# EAGLE schematic IDP_Main_Node_Carrier (EAGLE 7.7.0)
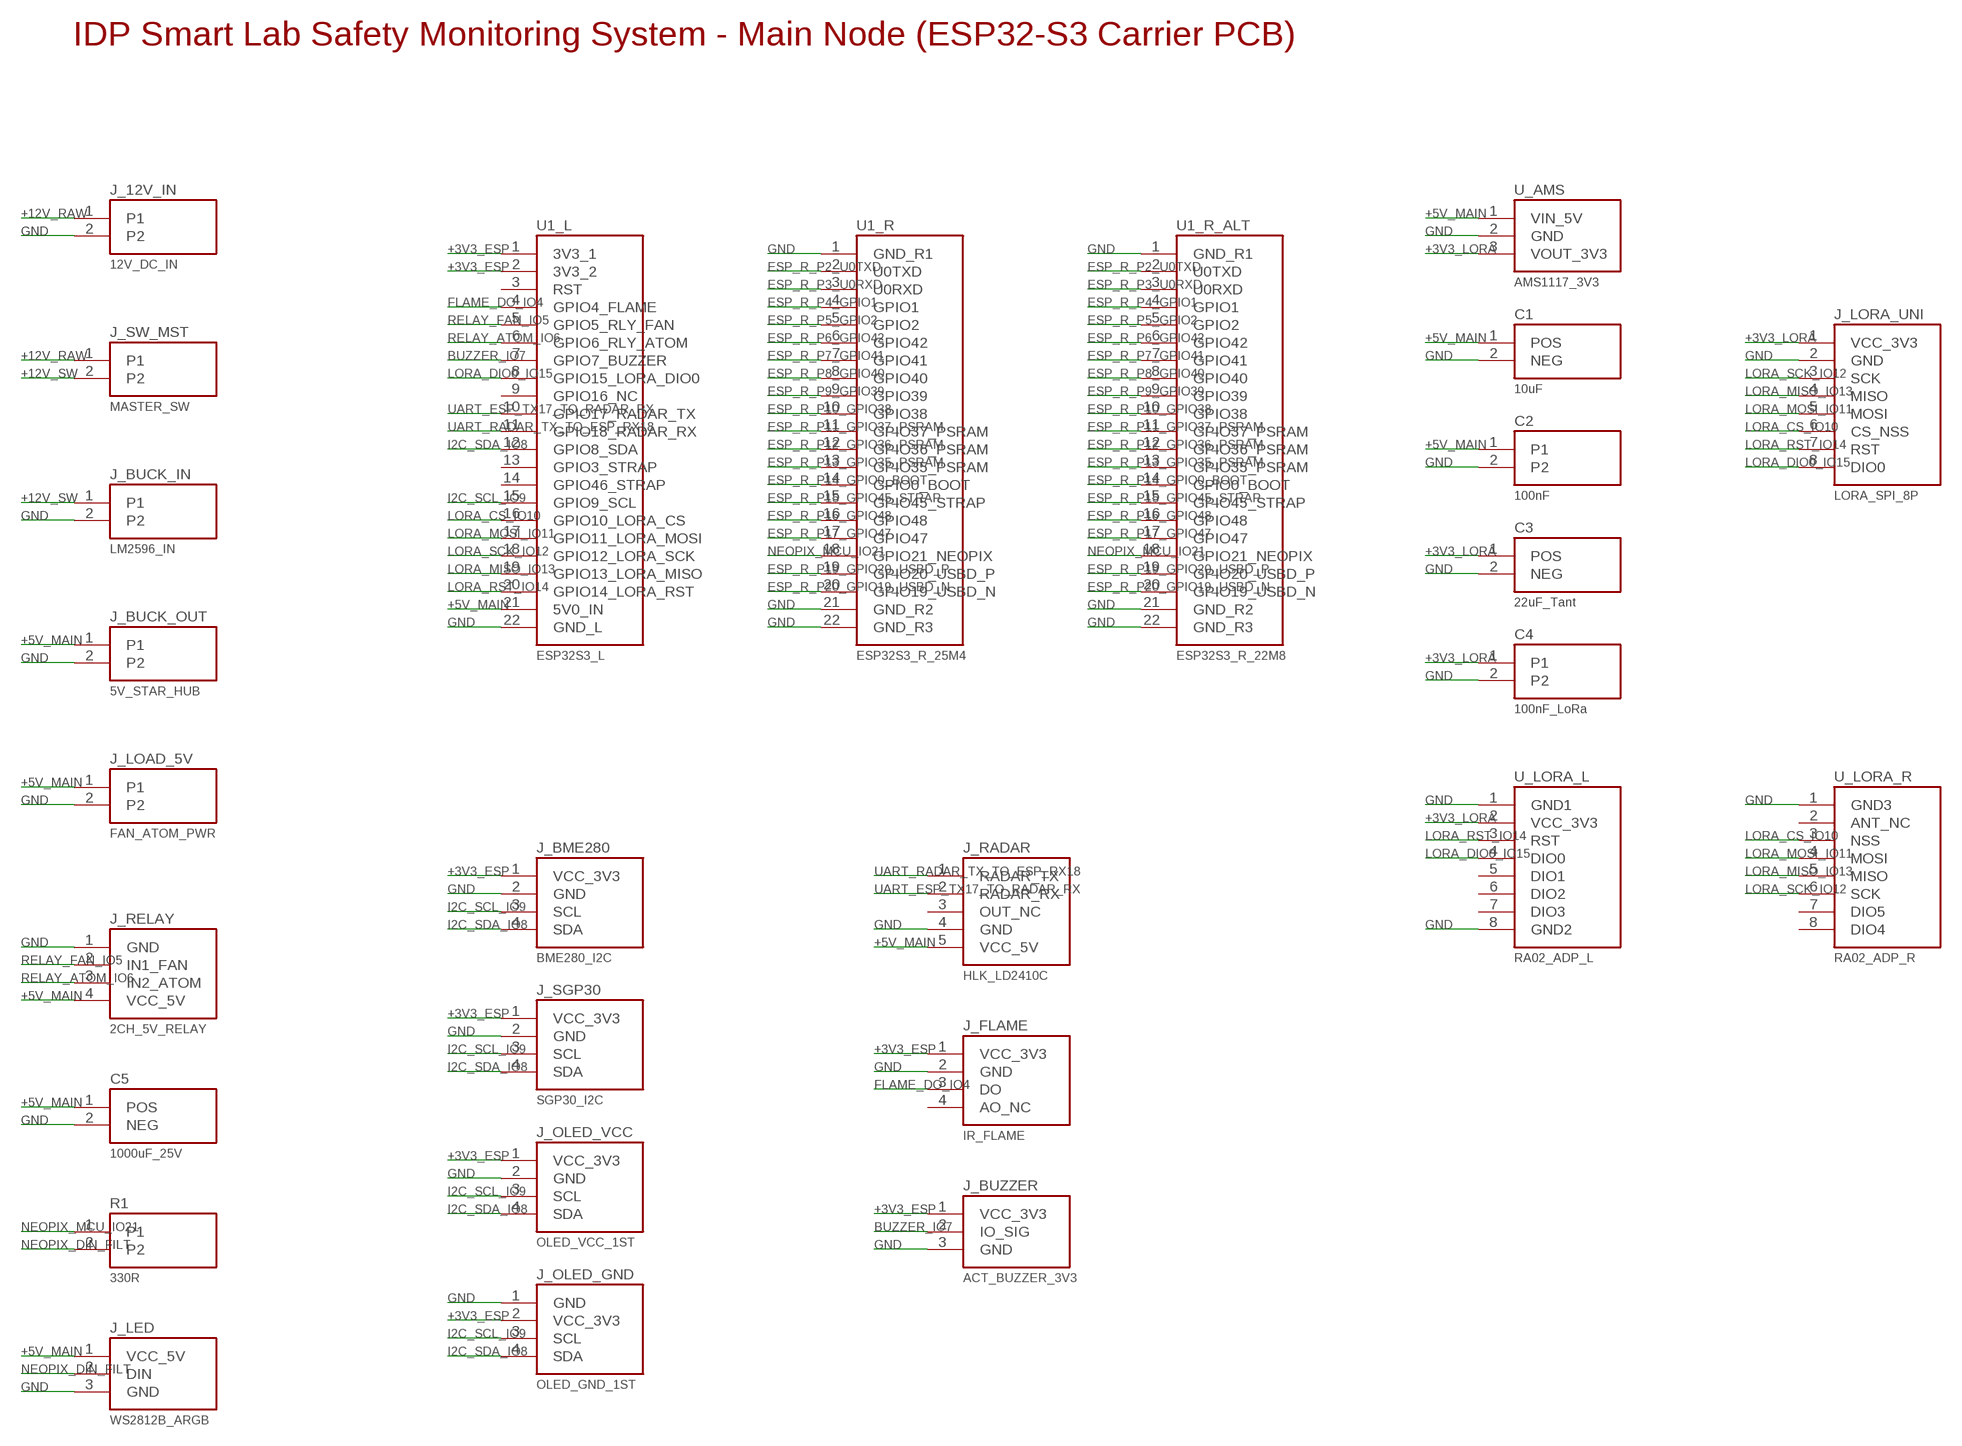
[diagram p0: schematic, sheet 1]

## Parts
C1  10uF  CAP_POL_254  [CAP_RAD_5MM_P254]
C2  100nF  CAP_CER_254  [CAP_DISC_P254]
C3  22uF_Tant  CAP_POL_254  [CAP_RAD_5MM_P254]
C4  100nF_LoRa  CAP_CER_254  [CAP_DISC_P254]
C5  1000uF_25V  CAP_BULK_1000UF  [CAP_ELEC_10MM_P500]
J_12V_IN  12V_DC_IN  KF301_PWR_2P  [KF301_2P_508]
J_BME280  BME280_I2C  I2C_SENSOR_4P  [HDR_1X4]
J_BUCK_IN  LM2596_IN  KF301_PWR_2P  [KF301_2P_508]
J_BUCK_OUT  5V_STAR_HUB  KF301_PWR_2P  [KF301_2P_508]
J_BUZZER  ACT_BUZZER_3V3  BUZZER_3P  [HDR_1X3]
J_FLAME  IR_FLAME  FLAME_SENSOR_4P  [HDR_1X4]
J_LED  WS2812B_ARGB  WS2812B_3P  [HDR_1X3]
J_LOAD_5V  FAN_ATOM_PWR  KF301_PWR_2P  [KF301_2P_508]
J_LORA_UNI  LORA_SPI_8P  LORA_UNI_8P  [HDR_1X8]
J_OLED_GND  OLED_GND_1ST  OLED_GND_FIRST_4P  [HDR_1X4]
J_OLED_VCC  OLED_VCC_1ST  I2C_SENSOR_4P  [HDR_1X4]
J_RADAR  HLK_LD2410C  RADAR_LD2410C_5P  [HDR_1X5]
J_RELAY  2CH_5V_RELAY  RELAY_2CH_4P  [HDR_1X4]
J_SGP30  SGP30_I2C  I2C_SENSOR_4P  [HDR_1X4]
J_SW_MST  MASTER_SW  KF301_PWR_2P  [KF301_2P_508]
R1  330R  RES_330R  [RES_AXIAL_762]
U1_L  ESP32S3_L  ESP32S3_LEFT_22P  [HDR_1X22]
U1_R  ESP32S3_R_25M4  ESP32S3_RIGHT_22P  [HDR_1X22]
U1_R_ALT  ESP32S3_R_22M8  ESP32S3_RIGHT_22P  [HDR_1X22]
U_AMS  AMS1117_3V3  AMS1117_MOD_3P  [HDR_1X3]
U_LORA_L  RA02_ADP_L  LORA_RA02_L8  [HDR_1X8]
U_LORA_R  RA02_ADP_R  LORA_RA02_R8  [HDR_1X8]

## Nets
+3V3_ESP [power]: J_BME280.1(VCC_3V3) J_BUZZER.1(VCC_3V3) J_FLAME.1(VCC_3V3) J_OLED_GND.2(VCC_3V3) J_OLED_VCC.1(VCC_3V3) J_SGP30.1(VCC_3V3) U1_L.1(3V3_1) U1_L.2(3V3_2)
+3V3_LORA [power]: C3.1(POS) C4.1 J_LORA_UNI.1(VCC_3V3) U_AMS.3(VOUT_3V3) U_LORA_L.2(VCC_3V3)
+5V_MAIN [power]: C1.1(POS) C2.1 C5.1(POS) J_BUCK_OUT.1 J_LED.1(VCC_5V) J_LOAD_5V.1 J_RADAR.5(VCC_5V) J_RELAY.4(VCC_5V) U1_L.21(5V0_IN) U_AMS.1(VIN_5V)
+12V_RAW [power]: J_12V_IN.1 J_SW_MST.1
+12V_SW [power]: J_BUCK_IN.1 J_SW_MST.2
BUZZER_IO7: J_BUZZER.2(IO_SIG) U1_L.7(GPIO7_BUZZER)
ESP_R_P2_U0TXD: U1_R.2(U0TXD) U1_R_ALT.2(U0TXD)
ESP_R_P3_U0RXD: U1_R.3(U0RXD) U1_R_ALT.3(U0RXD)
ESP_R_P4_GPIO1: U1_R.4(GPIO1) U1_R_ALT.4(GPIO1)
ESP_R_P5_GPIO2: U1_R.5(GPIO2) U1_R_ALT.5(GPIO2)
ESP_R_P6_GPIO42: U1_R.6(GPIO42) U1_R_ALT.6(GPIO42)
ESP_R_P7_GPIO41: U1_R.7(GPIO41) U1_R_ALT.7(GPIO41)
ESP_R_P8_GPIO40: U1_R.8(GPIO40) U1_R_ALT.8(GPIO40)
ESP_R_P9_GPIO39: U1_R.9(GPIO39) U1_R_ALT.9(GPIO39)
ESP_R_P10_GPIO38: U1_R.10(GPIO38) U1_R_ALT.10(GPIO38)
ESP_R_P11_GPIO37_PSRAM: U1_R.11(GPIO37_PSRAM) U1_R_ALT.11(GPIO37_PSRAM)
ESP_R_P12_GPIO36_PSRAM: U1_R.12(GPIO36_PSRAM) U1_R_ALT.12(GPIO36_PSRAM)
ESP_R_P13_GPIO35_PSRAM: U1_R.13(GPIO35_PSRAM) U1_R_ALT.13(GPIO35_PSRAM)
ESP_R_P14_GPIO0_BOOT: U1_R.14(GPIO0_BOOT) U1_R_ALT.14(GPIO0_BOOT)
ESP_R_P15_GPIO45_STRAP: U1_R.15(GPIO45_STRAP) U1_R_ALT.15(GPIO45_STRAP)
ESP_R_P16_GPIO48: U1_R.16(GPIO48) U1_R_ALT.16(GPIO48)
ESP_R_P17_GPIO47: U1_R.17(GPIO47) U1_R_ALT.17(GPIO47)
ESP_R_P19_GPIO20_USBD_P: U1_R.19(GPIO20_USBD_P) U1_R_ALT.19(GPIO20_USBD_P)
ESP_R_P20_GPIO19_USBD_N: U1_R.20(GPIO19_USBD_N) U1_R_ALT.20(GPIO19_USBD_N)
FLAME_DO_IO4: J_FLAME.3(DO) U1_L.4(GPIO4_FLAME)
GND [power]: C1.2(NEG) C2.2 C3.2(NEG) C4.2 C5.2(NEG) J_12V_IN.2 J_BME280.2(GND) J_BUCK_IN.2 J_BUCK_OUT.2 J_BUZZER.3(GND) J_FLAME.2(GND) J_LED.3(GND) J_LOAD_5V.2 J_LORA_UNI.2(GND) J_OLED_GND.1(GND) J_OLED_VCC.2(GND) J_RADAR.4(GND) J_RELAY.1(GND) J_SGP30.2(GND) U1_L.22(GND_L) U1_R.1(GND_R1) U1_R.21(GND_R2) U1_R.22(GND_R3) U1_R_ALT.1(GND_R1) U1_R_ALT.21(GND_R2) U1_R_ALT.22(GND_R3) U_AMS.2(GND) U_LORA_L.1(GND1) U_LORA_L.8(GND2) U_LORA_R.1(GND3)
I2C_SCL_IO9: J_BME280.3(SCL) J_OLED_GND.3(SCL) J_OLED_VCC.3(SCL) J_SGP30.3(SCL) U1_L.15(GPIO9_SCL)
I2C_SDA_IO8: J_BME280.4(SDA) J_OLED_GND.4(SDA) J_OLED_VCC.4(SDA) J_SGP30.4(SDA) U1_L.12(GPIO8_SDA)
LORA_CS_IO10: J_LORA_UNI.6(CS_NSS) U1_L.16(GPIO10_LORA_CS) U_LORA_R.3(NSS)
LORA_DIO0_IO15: J_LORA_UNI.8(DIO0) U1_L.8(GPIO15_LORA_DIO0) U_LORA_L.4(DIO0)
LORA_MISO_IO13: J_LORA_UNI.4(MISO) U1_L.19(GPIO13_LORA_MISO) U_LORA_R.5(MISO)
LORA_MOSI_IO11: J_LORA_UNI.5(MOSI) U1_L.17(GPIO11_LORA_MOSI) U_LORA_R.4(MOSI)
LORA_RST_IO14: J_LORA_UNI.7(RST) U1_L.20(GPIO14_LORA_RST) U_LORA_L.3(RST)
LORA_SCK_IO12: J_LORA_UNI.3(SCK) U1_L.18(GPIO12_LORA_SCK) U_LORA_R.6(SCK)
NEOPIX_DIN_FILT: J_LED.2(DIN) R1.2
NEOPIX_MCU_IO21: R1.1 U1_R.18(GPIO21_NEOPIX) U1_R_ALT.18(GPIO21_NEOPIX)
RELAY_ATOM_IO6: J_RELAY.3(IN2_ATOM) U1_L.6(GPIO6_RLY_ATOM)
RELAY_FAN_IO5: J_RELAY.2(IN1_FAN) U1_L.5(GPIO5_RLY_FAN)
UART_ESP_TX17_TO_RADAR_RX: J_RADAR.2(RADAR_RX) U1_L.10(GPIO17_RADAR_TX)
UART_RADAR_TX_TO_ESP_RX18: J_RADAR.1(RADAR_TX) U1_L.11(GPIO18_RADAR_RX)
Unconnected: J_FLAME.4(AO_NC) J_RADAR.3(OUT_NC) U1_L.3(RST) U1_L.9(GPIO16_NC) U1_L.13(GPIO3_STRAP) U1_L.14(GPIO46_STRAP) U_LORA_L.5(DIO1) U_LORA_L.6(DIO2) U_LORA_L.7(DIO3) U_LORA_R.2(ANT_NC) U_LORA_R.7(DIO5) U_LORA_R.8(DIO4)

## Notes on the sheet
- IDP Smart Lab Safety Monitoring System - Main Node (ESP32-S3 Carrier PCB)

## Library data of the parts
C1 C3 = IDP_Lab_Safety:CAP_POL_254
C2 C4 = IDP_Lab_Safety:CAP_CER_254
C5 = IDP_Lab_Safety:CAP_BULK_1000UF
J_12V_IN J_BUCK_IN J_BUCK_OUT J_LOAD_5V J_SW_MST = IDP_Lab_Safety:KF301_PWR_2P
J_BME280 J_OLED_VCC J_SGP30 = IDP_Lab_Safety:I2C_SENSOR_4P
J_BUZZER = IDP_Lab_Safety:BUZZER_3P
J_FLAME = IDP_Lab_Safety:FLAME_SENSOR_4P
J_LED = IDP_Lab_Safety:WS2812B_3P
J_LORA_UNI = IDP_Lab_Safety:LORA_UNI_8P
J_OLED_GND = IDP_Lab_Safety:OLED_GND_FIRST_4P
J_RADAR = IDP_Lab_Safety:RADAR_LD2410C_5P
J_RELAY = IDP_Lab_Safety:RELAY_2CH_4P
R1 = IDP_Lab_Safety:RES_330R
U1_L = IDP_Lab_Safety:ESP32S3_LEFT_22P
U1_R U1_R_ALT = IDP_Lab_Safety:ESP32S3_RIGHT_22P
U_AMS = IDP_Lab_Safety:AMS1117_MOD_3P
U_LORA_L = IDP_Lab_Safety:LORA_RA02_L8
U_LORA_R = IDP_Lab_Safety:LORA_RA02_R8

## Net classes
0 default: width 0.3 mm
1 power: width 0.8 mm